# Altium project STM32C0_ST25R100_EVK.PrjPcb
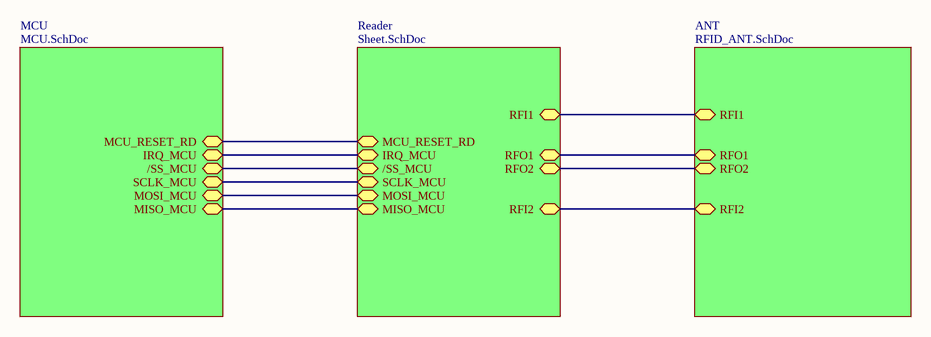
[diagram p0: STM32C0_ST25R100_EVK.SchDoc]
4 sheets, 84 parts. Net scope: hierarchical (ports join the sheet entries above them; power ports are global).
Board file: STM32C0_ST25R100_EVK.PcbDoc
Sheets:
  STM32C0_ST25R100_EVK.SchDoc
    MCU = MCU.SchDoc
    Reader = Sheet.SchDoc
    ANT = RFID_ANT.SchDoc

## Sheet STM32C0_ST25R100_EVK.SchDoc
size A; SheetNumber: 1; SheetTotal: 4

### Sub-sheets
ANT = RFID_ANT.SchDoc: RFI1 (bidir), RFI2 (bidir), RFO1 (bidir), RFO2 (bidir)
MCU = MCU.SchDoc: /SS_MCU (bidir), MOSI_MCU (bidir), SCLK_MCU (bidir), IRQ_MCU (bidir), MISO_MCU (bidir), MCU_RESET_RD (bidir)
Reader = Sheet.SchDoc: /SS_MCU (bidir), MOSI_MCU (bidir), SCLK_MCU (bidir), IRQ_MCU (bidir), MISO_MCU (bidir), MCU_RESET_RD (bidir), RFI1 (bidir), RFI2 (bidir), RFO1 (bidir), RFO2 (bidir)

### Nets
IRQ: sheet MCU/IRQ_MCU, sheet Reader/IRQ_MCU
RFI1: sheet Reader/RFI1, sheet ANT/RFI1
RFI2: sheet Reader/RFI2, sheet ANT/RFI2
RFO1: sheet Reader/RFO1, sheet ANT/RFO1
RFO2: sheet Reader/RFO2, sheet ANT/RFO2
SPIA_MISO: sheet MCU/MISO_MCU, sheet Reader/MISO_MCU
SPIA_MOSI: sheet MCU/MOSI_MCU, sheet Reader/MOSI_MCU
SPIA_NSS: sheet MCU//SS_MCU, sheet Reader//SS_MCU
SPIA_SCK: sheet MCU/SCLK_MCU, sheet Reader/SCLK_MCU
u_RST_RD: sheet MCU/MCU_RESET_RD, sheet Reader/MCU_RESET_RD

## Sheet MCU.SchDoc
size A2; SheetNumber: 3; SheetTotal: 4
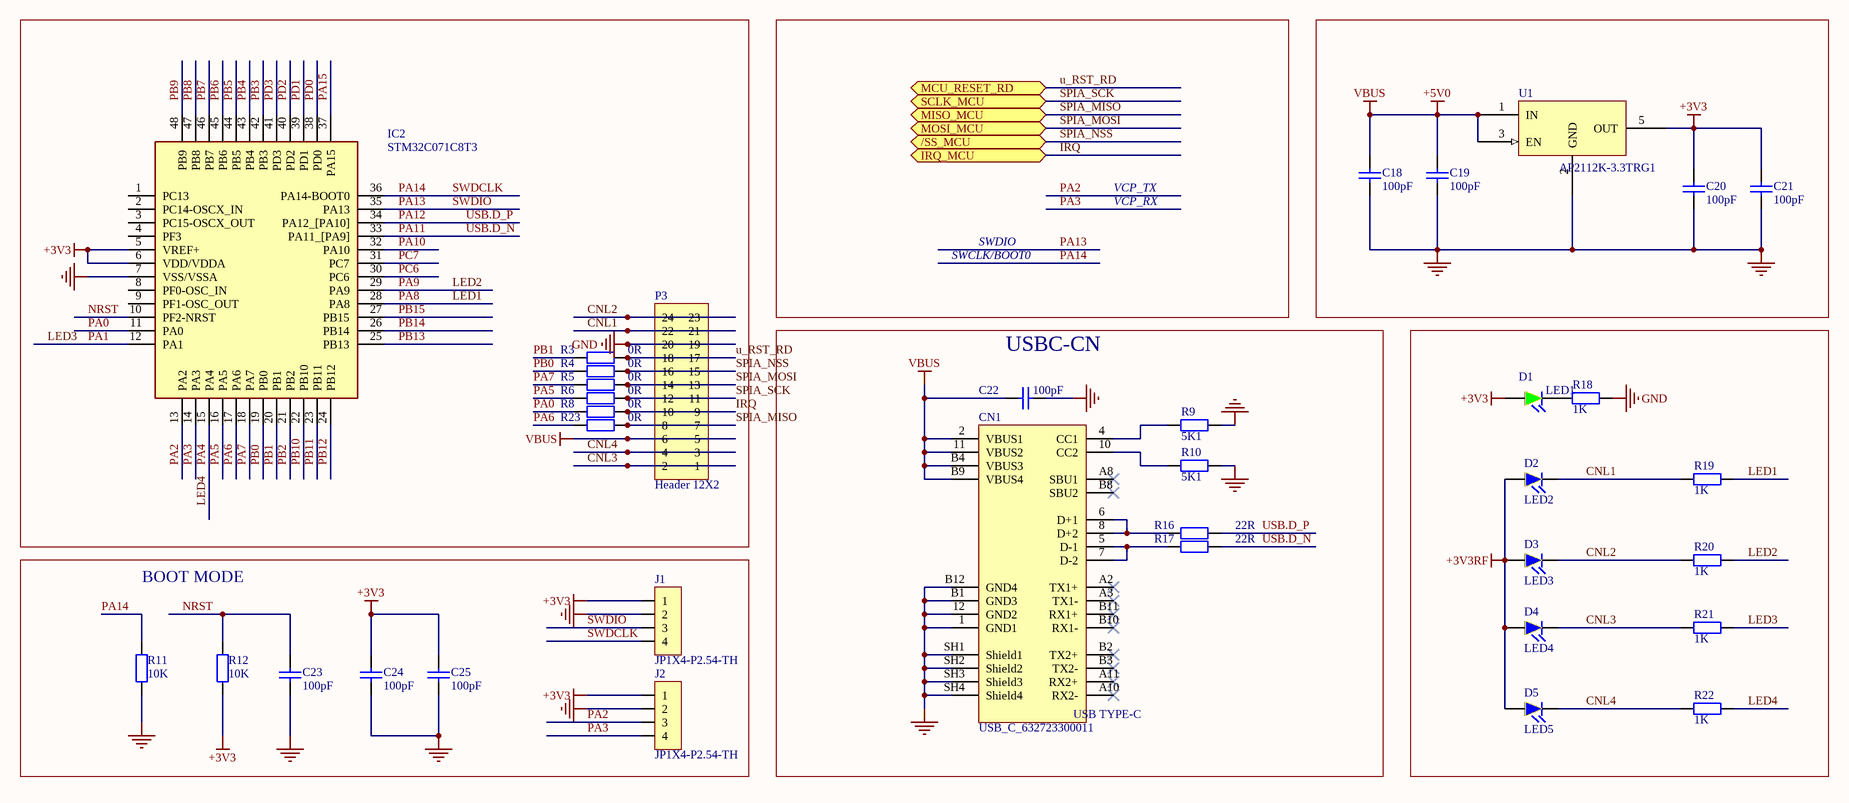
[diagram p1: MCU.SchDoc]

### Parts
C18  value 100pF  [CAP_CERAMIC_0603(1608mm)]  (hidden comment: Capacitor)
C19  value 100pF  [CAP_CERAMIC_0603(1608mm)]  (hidden comment: Capacitor)
C20  value 100pF  [CAP_CERAMIC_0603(1608mm)]  (hidden comment: Capacitor)
C21  value 100pF  [CAP_CERAMIC_0603(1608mm)]  (hidden comment: Capacitor)
C22  value 100pF  [CAP_CERAMIC_0603(1608mm)]  (hidden comment: Capacitor)
C23  value 100pF  [CAP_CERAMIC_0603(1608mm)]  (hidden comment: Capacitor)
C24  value 100pF  [CAP_CERAMIC_0603(1608mm)]  (hidden comment: Capacitor)
C25  value 100pF  [CAP_CERAMIC_0603(1608mm)]  (hidden comment: Capacitor)
CN1  USB_C_632723300011  [CON_USB-TYPEC_WE_632723300011]
D1  LED1  [0805_Pol]
D2  LED2  [LED-2.54]
D3  LED3  [LED-2.54]
D4  LED4  [LED-2.54]
D5  LED5  [LED-2.54]
IC2  STM32C071C8T3  [QFP50P900X900X160-48N]
J1  JP1X4-P2.54-TH  [HDR1X4]
J2  JP1X4-P2.54-TH  [HDR1X4]
P3  Header 12X2  [HDR2X12]
R3  0R  [RES_0603(1608)]
R4  0R  [RES_0603(1608)]
R5  0R  [RES_0603(1608)]
R6  0R  [RES_0603(1608)]
R8  0R  [RES_0603(1608)]
R9  5K1  [RES_0603(1608)]
R10  5K1  [RES_0603(1608)]
R11  10K  [RES_0603(1608)]
R12  10K  [RES_0603(1608)]
R16  22R  [RES_0603(1608)]
R17  22R  [RES_0603(1608)]
R18  1K  [RES_0603(1608)]
R19  1K  [RES_0603(1608)]
R20  1K  [RES_0603(1608)]
R21  1K  [RES_0603(1608)]
R22  1K  [RES_0603(1608)]
R23  0R  [RES_0603(1608)]
U1  AP2112K-3.3TRG1  [SOT23-5]

### Blocks framed on the sheet
USBC-CN: C22 CN1 R9 R10 R16 R17
BOOT MODE: C23-C25 J1 J2 R11 R12

### Ports
/SS_MCU (bidir, see STM32C0_ST25R100_EVK[2B], Sheet[1C]), IRQ_MCU (bidir, see STM32C0_ST25R100_EVK[2B], Sheet[1C]), MCU_RESET_RD (bidir, see STM32C0_ST25R100_EVK[2B], Sheet[1B]), MISO_MCU (bidir, see STM32C0_ST25R100_EVK[2B], Sheet[1C]), MOSI_MCU (bidir, see STM32C0_ST25R100_EVK[2B], Sheet[1C]), SCLK_MCU (bidir, see STM32C0_ST25R100_EVK[2B], Sheet[1C])

### Nets
+3V3: C20.2 C21.2 C24.2 C25.2 D1.1(A) IC2.5(VREF+) IC2.6(VDD/VDDA) J1.1 J2.1 R12.1 U1.5(OUT)
+3V3RF: D2.1(A) D3.1(A) D4.1(A) D5.1(A)
+5V0: C18.2 C19.2 C22.1 CN1.2(VBUS1) CN1.11(VBUS2) CN1.B4(VBUS3) CN1.B9(VBUS4) P3.5 P3.6 U1.1(IN) U1.3(EN)  [also labelled VBUS]
GND: C18.1 C19.1 C20.1 C21.1 C22.2 C23.1 C24.1 C25.1 CN1.1(GND1) CN1.12(GND2) CN1.B1(GND3) CN1.B12(GND4) CN1.SH1(Shield1) CN1.SH2(Shield2) CN1.SH3(Shield3) CN1.SH4(Shield4) IC2.7(VSS/VSSA) J1.2 J2.2 P3.19 P3.20 R9.1 R10.1 R11.1 R18.1 U1.2(GND)
CNL1: D2.2(K) P3.21 P3.22 R19.2
CNL2: D3.2(K) P3.23 P3.24 R20.2
CNL3: D4.2(K) P3.1 P3.2 R21.2
CNL4: D5.2(K) P3.3 P3.4 R22.2
IRQ: P3.9 P3.10 R8.2 ; port IRQ_MCU
LED1: IC2.28(PA8) R19.1  [also labelled PA8]
LED2: IC2.29(PA9) R20.1  [also labelled PA9]
LED3: IC2.12(PA1) R21.1  [also labelled PA1]
LED4: IC2.15(PA4) R22.1  [also labelled PA4]
NRST: C23.2 IC2.10(PF2-NRST) R12.2
PA0: IC2.11(PA0) R8.1
PA2: IC2.13(PA2) J2.3
PA3: IC2.14(PA3) J2.4
PA5: IC2.16(PA5) R6.1
PA6: IC2.17(PA6) R23.1
PA7: IC2.18(PA7) R5.1
PA10: IC2.32(PA10)
PA11: IC2.33(PA11_[PA9]) R17.1  [also labelled USB.D_N]
PA12: IC2.34(PA12_[PA10]) R16.1  [also labelled USB.D_P]
PA13: IC2.35(PA13) J1.3  [also labelled SWDIO]
PA14: IC2.36(PA14-BOOT0) J1.4 R11.2  [also labelled SWDCLK]
PA15: IC2.37(PA15)
PB0: IC2.19(PB0) R4.1
PB1: IC2.20(PB1) R3.1
PB2: IC2.21(PB2)
PB3: IC2.42(PB3)
PB4: IC2.43(PB4)
PB5: IC2.44(PB5)
PB6: IC2.45(PB6)
PB7: IC2.46(PB7)
PB8: IC2.47(PB8)
PB9: IC2.48(PB9)
PB10: IC2.22(PB10)
PB11: IC2.23(PB11)
PB12: IC2.24(PB12)
PB13: IC2.25(PB13)
PB14: IC2.26(PB14)
PB15: IC2.27(PB15)
PC6: IC2.30(PC6)
PC7: IC2.31(PC7)
PD0: IC2.38(PD0)
PD1: IC2.39(PD1)
PD2: IC2.40(PD2)
PD3: IC2.41(PD3)
SPIA_MISO: P3.7 P3.8 R23.2 ; port MISO_MCU
SPIA_MOSI: P3.13 P3.14 R5.2 ; port MOSI_MCU
SPIA_NSS: P3.15 P3.16 R4.2 ; port /SS_MCU
SPIA_SCK: P3.11 P3.12 R6.2 ; port SCLK_MCU
u_RST_RD: P3.17 P3.18 R3.2 ; port MCU_RESET_RD
NetCN1_4: CN1.4(CC1) R9.2
NetCN1_5: CN1.5(D-1) CN1.7(D-2) R17.2
NetCN1_6: CN1.6(D+1) CN1.8(D+2) R16.2
NetCN1_10: CN1.10(CC2) R10.2
NetD1_2: D1.2(K) R18.2

Not connected (* = marked no-connect by the designer): CN1 A2(TX1+)* A3(TX1-)* A8(SBU1)* A10(RX2-)* A11(RX2+)* B2(TX2+)* B3(TX2-)* B8(SBU2)* B10(RX1-)* B11(RX1+)*; IC2 1(PC13) 2(PC14-OSCX_IN) 3(PC15-OSCX_OUT) 4(PF3) 8(PF0-OSC_IN) 9(PF1-OSC_OUT)

### Notes on the sheet
- SWDIO
- VCP_TX
- VCP_RX
- SWCLK/BOOT0
- (in symbol MCD-02273) USB TYPE-C

### Library data of the parts
C18-C25 = MCD-00205: Capacitor, MLCC, 100pF, 50V, NPO, +/-5%, 0402, T=0.5mm; Part_Preference: Recommended; Manufacturer: YAGEO; Manufacturer_Part_Number: CC0402JRNPO9BN101; Component_Country_Of_Origin: China; ShowFields: YES; ID: 2658; Internal_Part_Number: MCD-00205; Status: Released; Part_Type: Capacitor; Package: 0402; ComponentLink1URL: http://tunmcdsvn.tun.st.com/Component_Documentation_Library/Trunk/Capacitor/YAGEO_NP0_Series; Order_Code_Digikey: 311-1024-1-ND; Order_Code_Farnell: 3019226RL; Order_Code_RS: N/A
CN1 = MCD-02273: Connector_USB_TypeC, 24pins, RA, TH, T=1.9mm (USB certified); Part_Preference: Recommended; Manufacturer: WURTH ELEKTRONIK; Component_Country_Of_Origin: China; ShowFields: YES; ID: 4373; Internal_Part_Number: MCD-02273; Value: USB_C_632723300011; Status: Released; Part_Type: Connector; Manufacturer_Part_Number: 632723300011; ComponentLink1URL: http://tunmcdsvn.tun.st.com/Component_Datasheet_Library/Trunk/Connectors/WURTH_ELEKTRONIK_USB_TYPE-C_632723300011; Order_Code_Digikey: 732-9618-1-ND; Order_Code_Farnell: 2984404; Order_Code_RS: N/A
D1 = LED_Gr: LED 0805 GREEN 6.3MCD GAP ON GAP; Package: 0805; Parameter 1: *
D2-D5 = LED_BLUE: LED 3MM HI EFF BLUE DIFF; MFR: Vishay Semiconductor Opto Division; Part Number: TLHB4400; Vender Part: 751-1092-ND; Vender: Digikey; Package: Pitch:3mm; Eposi Code: *; Parameter 1: *
IC2 = STM32C071C8T3: Integrated Circuit; Manufacturer_Name: STMicroelectronics; Datasheet Link: https://www.st.com/resource/en/datasheet/stm32c071c8.pdf; Height: 1.6mm; Manufacturer_Part_Number: STM32C071C8T3
J1 J2 = JP1X4-P2.54-TH: Pin Header Single Row 2.54MM 4P - Through Hole
P3 = Header 12X2: Header, 12-Pin, Dual row; LatestRevisionDate: 17-Jul-2002; LatestRevisionNote: Re-released for DXP Platform.; Publisher: Altium Limited
R3-R6 R8-R12 R23 = R0603: Resistor SMD 0603(1608); MPN: RC0603FR-070RL; Package: 0603
  R3-R6 R8 R23: Value: 0R
  R9 R10: Value: 5K1
  R11 R12: Value: 10K
R16 R17 = R0603: Resistor SMD 0603(1608); MPN: RC0603FR-070RL; Value: 5K1; Package: 0603
R18-R22 = RC0603FR-0710KL: RES SMD 10K OHM 1% 1/10W 0603; Solder: SMT; Value: 1K; MPN: RC0603FR-0710KL; Parameter 1: *
U1 = AP2112K-3.3TRG1: IC REG LDO 3.3V 0.6A SOT25; CompanyID: VT-01101; Solder: SMT; MPN: AP2112K-3.3TRG1; Value: AP2112K-3.3TRG1

## Sheet Sheet.SchDoc
size A; SheetNumber: 2; SheetTotal: 4
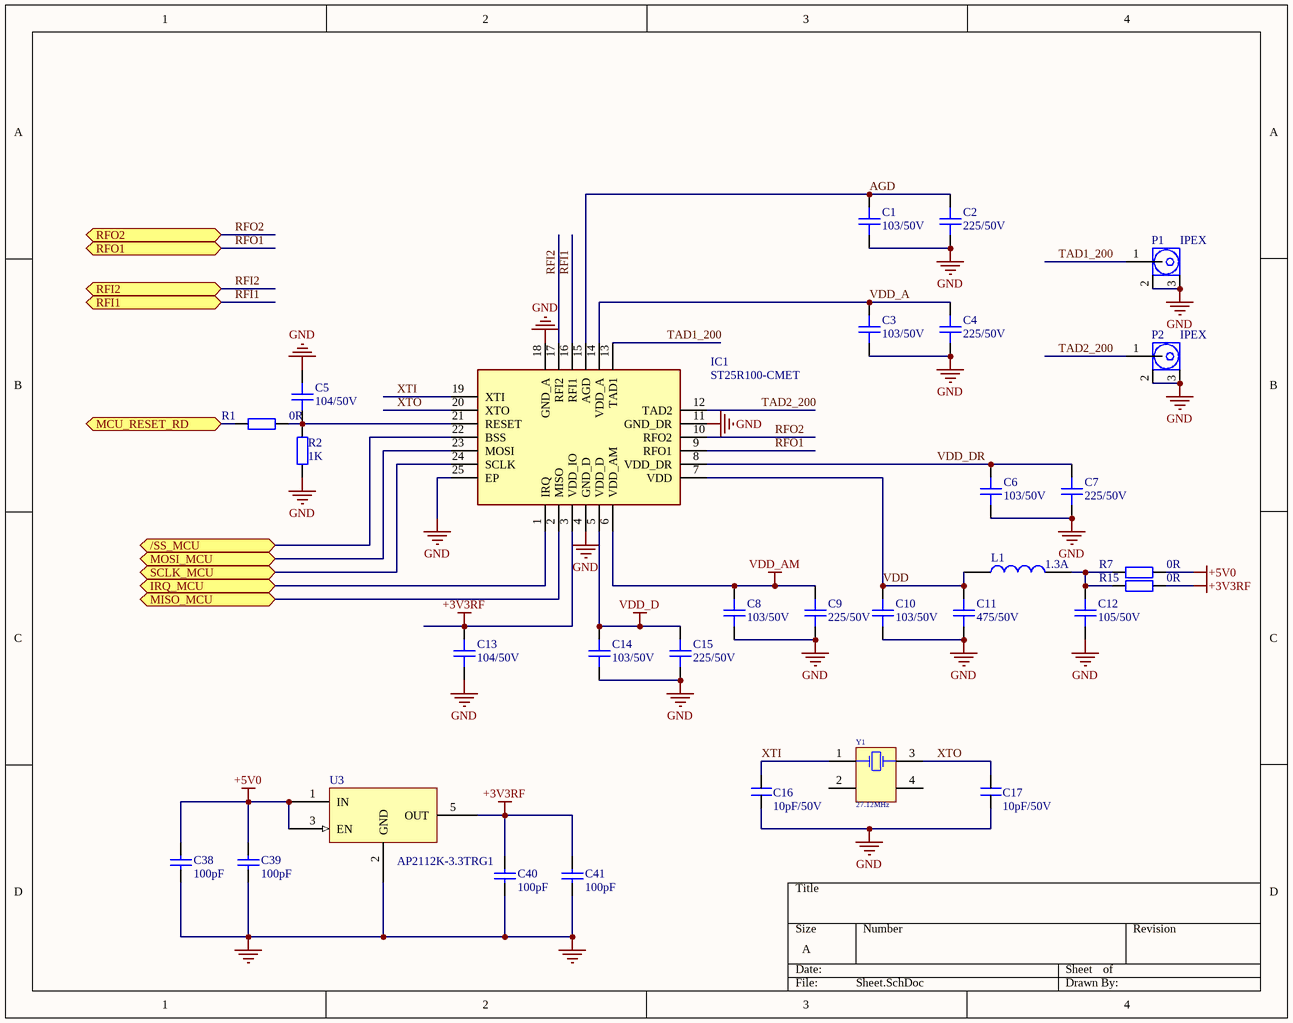
[diagram p2: Sheet.SchDoc]

### Parts
C1  103/50V  [CAP_CERAMIC_0603(1608mm)]
C2  225/50V  [CAP_CERAMIC_0603(1608mm)]
C3  103/50V  [CAP_CERAMIC_0603(1608mm)]
C4  225/50V  [CAP_CERAMIC_0603(1608mm)]
C5  104/50V  [CAP_CERAMIC_0603(1608mm)]
C6  103/50V  [CAP_CERAMIC_0603(1608mm)]
C7  225/50V  [CAP_CERAMIC_0603(1608mm)]
C8  103/50V  [CAP_CERAMIC_0603(1608mm)]
C9  225/50V  [CAP_CERAMIC_0603(1608mm)]
C10  103/50V  [CAP_CERAMIC_0603(1608mm)]
C11  475/50V  [CAP_CERAMIC_0603(1608mm)]
C12  105/50V  [CAP_CERAMIC_0603(1608mm)]
C13  104/50V  [CAP_CERAMIC_0603(1608mm)]
C14  103/50V  [CAP_CERAMIC_0603(1608mm)]
C15  225/50V  [CAP_CERAMIC_0603(1608mm)]
C16  10pF/50V  [CAP_CERAMIC_0603(1608mm)]
C17  10pF/50V  [CAP_CERAMIC_0603(1608mm)]
C38  value 100pF  [CAP_CERAMIC_0603(1608mm)]  (hidden comment: Capacitor)
C39  value 100pF  [CAP_CERAMIC_0603(1608mm)]  (hidden comment: Capacitor)
C40  value 100pF  [CAP_CERAMIC_0603(1608mm)]  (hidden comment: Capacitor)
C41  value 100pF  [CAP_CERAMIC_0603(1608mm)]  (hidden comment: Capacitor)
IC1  ST25R100-CMET  [QFN50P400X400X60-25N-D]
L1  1.3A  [FEB_0603(1608)]
P1  IPEX  [SMA-ANT]
P2  IPEX  [SMA-ANT]
R1  0R  [RES_0603(1608)]
R2  1K  [RES_0603(1608)]
R7  0R  [RES_0603(1608)]
R15  0R  [RES_0603(1608)]
U3  AP2112K-3.3TRG1  [SOT23-5]
Y1  value 27.12MHz  [TSX-3225]  (hidden comment: Quartz Crystal   4-Pin TSX-3225   27.12MHz)

### Ports
/SS_MCU (bidir, see STM32C0_ST25R100_EVK[2B], MCU[3B]), IRQ_MCU (bidir, see STM32C0_ST25R100_EVK[2B], MCU[3B]), MCU_RESET_RD (bidir, see STM32C0_ST25R100_EVK[2B], MCU[3B]), MISO_MCU (bidir, see STM32C0_ST25R100_EVK[2B], MCU[3B]), MOSI_MCU (bidir, see STM32C0_ST25R100_EVK[2B], MCU[3B]), RFI1 (bidir, see STM32C0_ST25R100_EVK[3B], RFID_ANT[1B]), RFI2 (bidir, see STM32C0_ST25R100_EVK[3B], RFID_ANT[1A]), RFO1 (bidir, see STM32C0_ST25R100_EVK[3B], RFID_ANT[1B]), RFO2 (bidir, see STM32C0_ST25R100_EVK[3B], RFID_ANT[1B]), SCLK_MCU (bidir, see STM32C0_ST25R100_EVK[2B], MCU[3B])

### Nets
+3V3RF: C13.2 C40.2 C41.2 IC1.3(VDD_IO) R15.2 U3.5(OUT)
+5V0: C38.2 C39.2 R7.2 U3.1(IN) U3.3(EN)
GND: C1.1 C2.1 C3.1 C4.1 C5.2 C6.1 C7.1 C8.1 C9.1 C10.1 C11.1 C12.1 C13.1 C14.1 C15.1 C16.2 C17.2 C38.1 C39.1 C40.1 C41.1 IC1.4(GND_D) IC1.11(GND_DR) IC1.18(GND_A) IC1.25(EP) P1.2 P1.3 P2.2 P2.3 R2.1 U3.2(GND)
VDD_AM: C8.2 C9.2 IC1.6(VDD_AM)
VDD_D: C14.2 C15.2 IC1.5(VDD_D)
AGD: C1.2 C2.2 IC1.15(AGD)
IRQ: IC1.1(IRQ) ; port IRQ_MCU
RFI1: IC1.16(RFI1) ; port RFI1
RFI2: IC1.17(RFI2) ; port RFI2
RFO1: IC1.9(RFO1) ; port RFO1
RFO2: IC1.10(RFO2) ; port RFO2
SPIA_MISO: IC1.2(MISO) ; port MISO_MCU
SPIA_MOSI: IC1.23(MOSI) ; port MOSI_MCU
SPIA_NSS: IC1.22(BSS) ; port /SS_MCU
SPIA_SCK: IC1.24(SCLK) ; port SCLK_MCU
TAD1_200: IC1.13(TAD1) P1.1
TAD2_200: IC1.12(TAD2) P2.1
u_RST_RD: R1.1 ; port MCU_RESET_RD
VDD: C10.2 C11.2 IC1.7(VDD) L1.1
VDD_A: C3.2 C4.2 IC1.14(VDD_A)
VDD_DR: C6.2 C7.2 IC1.8(VDD_DR)
XTI: C16.1 IC1.19(XTI) Y1.1(OSC1)
XTO: C17.1 IC1.20(XTO) Y1.3(OSC2)
NetC5_1: C5.1 IC1.21(RESET) R1.2 R2.2
NetC12_2: C12.2 L1.2 R7.1 R15.1

Not connected (* = marked no-connect by the designer): Y1 2(NC) 4(NC)

### Library data of the parts
C1-C15 = C0603: Capacitor Ceramic SMD 0603(1608); Value: 33p; Published: 8-Jun-2000; LatestRevisionDate: 17-Jul-2002; LatestRevisionNote: Re-released for DXP Platform.; PackageReference: RAD-0.3; Publisher: Altium Limited
C16 C17 = CC0603JRNPO9BN100: CAP CER 10PF 50V 5% COG/NPO 0603; MFR: TDK; SOLD: SMT; Package: 0603; Part Number: CC0603JRNPO9BN100
C38-C41 = MCD-00205: as C18 on sheet MCU; Internal_Part_Number: MCD-00205; Status: Released; Part_Type: Capacitor; Package: 0402; ComponentLink1URL: http://tunmcdsvn.tun.st.com/Component_Documentation_Library/Trunk/Capacitor/YAGEO_NP0_Series; Order_Code_Digikey: 311-1024-1-ND; Order_Code_Farnell: 3019226RL; Order_Code_RS: N/A
IC1 = ST25R100-CMET: Integrated Circuit; Manufacturer_Name: STMicroelectronics; Datasheet Link: https://www.st.com/resource/en/datasheet/st25r100.pdf; Height: 0.6mm; Manufacturer_Part_Number: ST25R100-CMET; Mouser Part Number: 511-ST25R100-CMET; Mouser Price/Stock: https://www.mouser.co.uk/ProductDetail/STMicroelectronics/ST25R100-CMET?qs=HoCaDK9Nz5cyKRkjt%2FIQ%2Fw%3D%3D
L1 = IND: IND-FIXED 0603; MPN: BLM15PD121SN1D; Solder: SMT; Value: 120 Ohms @ 100 MHz
P1 P2 = LTI-IPXSM66AL: IPX/U.FL Surface Mount Mating Receptacle; CompanyID: VT-01357; Solder: SMT; Value: IPEX_GPS; MPN: LTI-IPXSM66AL
R1 R7 R15 = R0603: as R3 on sheet MCU; Value: 0R; Package: 0603
R2 = RC0603FR-0710KL: as R18 on sheet MCU; Value: 1K; MPN: RC0603FR-0710KL; Parameter 1: *
U3 = AP2112K-3.3TRG1: as U1 on sheet MCU; MPN: AP2112K-3.3TRG1; Value: AP2112K-3.3TRG1
Y1 = 2SMX: Quartz Crystal   4-Pin SMD 3.2x2.5 mm   27.12 MHz; Note: PCB layout complies with manufacturer's recommendation.; Published: 17-Jul-2002; DatasheetDocument: 9-Sep-1999; PackageDocument: 9-Sep-1999; PackageReference: 2SMX; Publisher: Altium Limited; ComponentLink1Description: Manufacturer Link; ComponentLink1URL: http://www.cmac.com/mt/; Type: Crystal

## Sheet RFID_ANT.SchDoc
size A; SheetNumber: 4; SheetTotal: 4
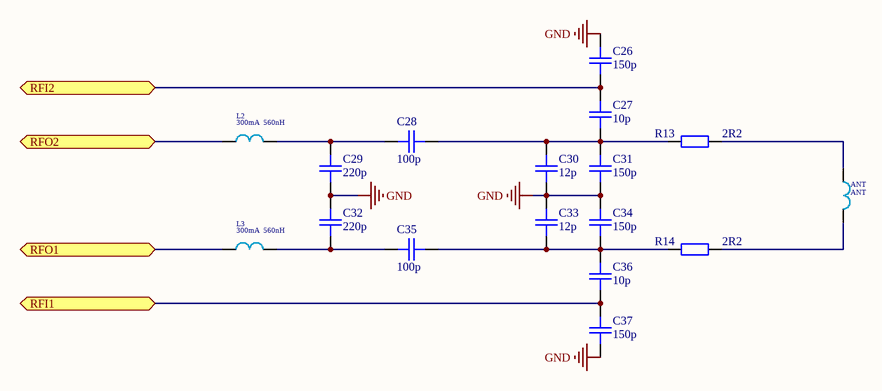
[diagram p3: RFID_ANT.SchDoc]

### Parts
ANT  ANT
C26  150p  [CAP_CERAMIC_0603(1608mm)]
C27  10p  [CAP_CERAMIC_0603(1608mm)]
C28  100p  [CAP_CERAMIC_0603(1608mm)]
C29  220p  [CAP_CERAMIC_0603(1608mm)]
C30  12p  [CAP_CERAMIC_0603(1608mm)]
C31  150p  [CAP_CERAMIC_0603(1608mm)]
C32  220p  [CAP_CERAMIC_0603(1608mm)]
C33  12p  [CAP_CERAMIC_0603(1608mm)]
C34  150p  [CAP_CERAMIC_0603(1608mm)]
C35  100p  [CAP_CERAMIC_0603(1608mm)]
C36  10p  [CAP_CERAMIC_0603(1608mm)]
C37  150p  [CAP_CERAMIC_0603(1608mm)]
L2  value 560nH  Imax: 300mA  (hidden comment: SDCL1608CR56)
L3  value 560nH  Imax: 300mA  (hidden comment: SDCL1608CR56)
R13  2R2  [RES_0603(1608)]
R14  2R2  [RES_0603(1608)]

### Ports
RFI1 (bidir, see STM32C0_ST25R100_EVK[3B], Sheet[1B]), RFI2 (bidir, see STM32C0_ST25R100_EVK[3B], Sheet[1B]), RFO1 (bidir, see STM32C0_ST25R100_EVK[3B], Sheet[1A]), RFO2 (bidir, see STM32C0_ST25R100_EVK[3B], Sheet[1A])

### Nets
GND: C26.2 C29.1 C30.1 C31.1 C32.2 C33.2 C34.2 C37.1
RFI1: C36.1 C37.2 ; port RFI1
RFI2: C26.1 C27.2 ; port RFI2
RFO1: L3.2 ; port RFO1
RFO2: L2.2 ; port RFO2
NetANT_1: ANT.1 R14.2
NetANT_2: ANT.2 R13.2
NetC27_1: C27.1 C28.1 C30.2 C31.2 R13.1
NetC28_2: C28.2 C29.2 L2.1
NetC32_1: C32.1 C35.2 L3.1
NetC33_1: C33.1 C34.1 C35.1 C36.2 R14.1

### Library data of the parts
ANT = L 0603 100n: Manufacturer: Shenzhen Sunlord Electronics Co., Ltd; Ind: 926nH; DCR: 1Ω; S.R.F.: 1400MHz; Package-mm: 1608; Tolerance %: ±5%; Q@100MHz: 65; Value: ANT; Temperature Range: -55°C ~ +125°C; TYPE: Inductors; Irms: *; Isat: *; Technology: Chip; Material: Ferrite; Published: *; Publisher: Hefest; Mount Type: SMT; ComponentLink1Description: Datasheet link; ComponentLink1URL: https://store.comet.bg/download-file.php?id=1927; RoHS: *; Manufacturer Alternate: *; Supplier 1: Comet; Supplier Part Number 1: *; Supplier 2: *; Supplier Part Number 2: *; Supplier 3: *; Supplier Part Number 3: *; Part Number Alternate: *; Price: *
C26 C27 C30 C33 C36 C37 = C0603: Capacitor Ceramic SMD 0603(1608); PackageReference: 0603
  C26 C37: Value: 150p
  C27 C36: Value: 10p
  C30 C33: Value: 12p
C28 C35 = C0603: Capacitor Ceramic SMD 0603(1608); Value: 47p; PackageReference: 0603
C29 C32 = C0603: Capacitor Ceramic SMD 0603(1608); Value: 270p; PackageReference: 0603
C31 C34 = C0603: Capacitor Ceramic SMD 0603(1608); Value: 130p; PackageReference: 0603
L2 L3 = L 0603 100n: SMD 0603   Multilayer High frequency Inductor   560 nH   100 mA   1 Ω Max   (Ex SDCL1608CR56JTDF...); PartNumber: SDCL1608CR56JTDF, SWEL1608CR56JT; Manufacturer: Shenzhen Sunlord Electronics Co., Ltd; TYPE: Inductors; DCR: 1Ω; Material: Ferrite; S.R.F.: 1400MHz; Package-mm: 1608; Tolerance %: ±5%; Q@100MHz: 65; Temperature Range: -55°C ~ +125°C; Ind: 560nH; Irms: *; Isat: *; Technology: Chip; Published: *; Publisher: Hefest; Mount Type: SMT; Package: 0603; ComponentLink1Description: Datasheet link; ComponentLink1URL: https://store.comet.bg/download-file.php?id=1927; RoHS: *; Manufacturer Alternate: *; Supplier 1: Comet; Supplier Part Number 1: *; Supplier 2: *; Supplier Part Number 2: *; Supplier 3: *; Supplier Part Number 3: *; Part Number Alternate: *; Price: *
R13 R14 = R0603: as R3 on sheet MCU; Value: 2R2; Package: 0603

## Nets that join several sheets
+3V3RF: MCU (D2.1 D3.1 D4.1 D5.1), Sheet (6 pins)
+5V0: MCU (11 pins), Sheet (5 pins)
GND: MCU (26 pins), Sheet (31 pins), RFID_ANT (8 pins)
IRQ: MCU (P3.9 P3.10 R8.2), Sheet (IC1.1)
RFI1: Sheet (IC1.16), RFID_ANT (C36.1 C37.2)
RFI2: Sheet (IC1.17), RFID_ANT (C26.1 C27.2)
RFO1: Sheet (IC1.9), RFID_ANT (L3.2)
RFO2: Sheet (IC1.10), RFID_ANT (L2.2)
SPIA_MISO: MCU (P3.7 P3.8 R23.2), Sheet (IC1.2)
SPIA_MOSI: MCU (P3.13 P3.14 R5.2), Sheet (IC1.23)
SPIA_NSS: MCU (P3.15 P3.16 R4.2), Sheet (IC1.22)
SPIA_SCK: MCU (P3.11 P3.12 R6.2), Sheet (IC1.24)
u_RST_RD: MCU (P3.17 P3.18 R3.2), Sheet (R1.1)